# Altium project PGS-System.PrjPcb (part 16 of 16)

## Sheet DEBUG_UART_INTERFACE.SchDoc
size A4; SheetNumber: 26; SheetTotal: 26
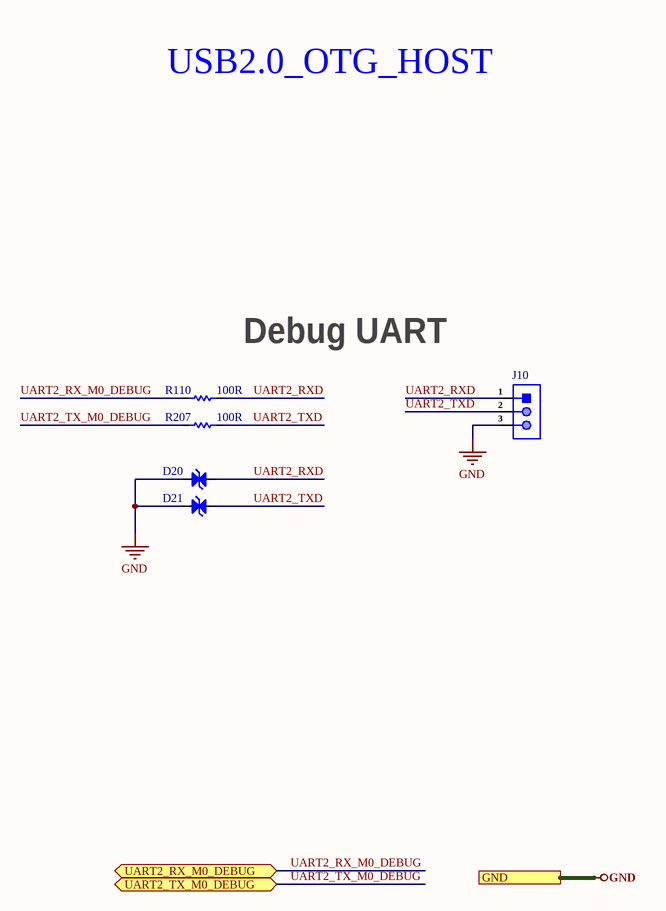
[diagram p27: DEBUG_UART_INTERFACE.SchDoc]

### Parts
D20  ESD5451N  [DFN1006-2L (Bi-Directional)]  (value not drawn)
D21  ESD5451N  [DFN1006-2L (Bi-Directional)]  (value not drawn)
J10  X6511WV-03H-C60D30  [HDR1X3_]  (value not drawn)
R110  100R  [Res-0402]
R207  100R  [Res-0402]

### Ports
GND (see DDR3_SDRAM_INTERFACE[4D], DIGITAL_MEMS_MIC_INTERFACE[3D], eMMC_INTERFACE[3D], ETHERNET_SWITCH_INTERFACE[5C], IR-CUT_LIGHT SENSOR_SHEET[3D], MIPI TO HDMI_MODULE_INTERFACE[3D], MIPI-CSI_RXX_INTERFACE[4C], PoE PD INTERFACE[3D], PoE_PSE_CONTROLLER[5D], POWER_LDO_SHEET[3D], POWER_PMIC_RK809_CODEC[3D], POWER_PMIC_RK809_DC DC[3D], POWER_PMIC_RK809_LDO[4C], POWER_PMIC_RK809_MANAGEMENT[3D], RV1126_AUDIO_SHEET[3D], RV1126_DRAM_SHEET[4C], RV1126_eMMC_SPI-FLASH_SHEET[3D], RV1126_ETHERNET_SHEET[3D], RV1126_OSC-PLL-PMUIO[3C], RV1126_POWER_SHEET[1D], RV1126_SARADC_SHEET[3C], SPI_FLASH_INTERFACE[3D], SYNCHRONOUS _BUCK_CONTROLLER[3D], USB2.0_DEBUG_UART[3D], WIFI_AP6256_SHEET[4D]), UART2_RX_M0_DEBUG (bidir, see RV1126_OSC-PLL-PMUIO[3D], RV1126_SARADC_SHEET[2D], USB2.0_DEBUG_UART[2D]), UART2_TX_M0_DEBUG (bidir, see RV1126_OSC-PLL-PMUIO[3D], RV1126_SARADC_SHEET[2D], USB2.0_DEBUG_UART[2D])

### Nets
GND: D20.2(K) D21.2(K) J10.3 ; port GND  [project net KSENSD]
UART2_RX_M0_DEBUG: R110.2 ; port UART2_RX_M0_DEBUG
UART2_RXD: D20.1(K) J10.1 R110.1
UART2_TX_M0_DEBUG: R207.2 ; port UART2_TX_M0_DEBUG
UART2_TXD: D21.1(K) J10.2 R207.1

### Notes on the sheet
- USB2.0_OTG_HOST
- Debug UART
- File:
- Title:
- Date:
- Page
- Num:
- Total:
- Drawn By: Huzaifa Ali

### Library data of the parts
D20 D21 = ESD5451N: DFN1006-2(0402) ESD Protection Devices ROHS; Manufacturer: TECH PUBLIC; Manufacturer Part Number: ESD5451N; Footprint: DFN1006-2(0402); ComponentLink1Description: LCSC; ComponentLink1URL: https://www.lcsc.com/product-detail/span-style-background-color-ff0-ESD-span-Protection-Devices_TECH-PUBLIC-ESD5451N_C2936977.html; LCSC Part Number: C2936977
J10 = X6511WV-03H-C60D30: Gold 250V 3A Straight Square Pins 2.5mm 3P 260℃ 6mm -40℃~+105℃ 3mm 2.54mm Plugin Black Brass 1x3P Plugin,P=2.54mm Pin Headers ROHS; Manufacturer: XKB; Item Type: Male Header; Manufacturer Part Number: X6511WV-03H-C60D30; Package: Plugin,P=2.54mm; LCSC Part Number: C706875; ComponentLink1Description: LCSC; ComponentLink1URL: https://www.lcsc.com/product-detail/Pin-Headers_XKB-Connectivity-X6511WV-03H-C60D30_C706875.html
R110 R207 = RC0402FR-07100RL: RES 100 OHM 1% 1/16W 0402; Manufacturer: Yageo; Power Rating: 62.5mW; Voltage Rating: 50V; Temperature Coefficient: 100ppm/°C; Max Power Dissipation: 63mW; Item Type: Resistor; Supplier 1: Mouser; Manufacturer Part Number: RC0402FR-07100RL; RoHS: Yes; Category: Chip SMD Resistors; Stock 1: 699545; Pricing 1: 1=0.10000, 10=0.01200, 50=0.01200, 100=0.00500, 1000=0.00300, 2500=0.00200, 10000=0.00100 (USD); Case/Package: 0402; Number of Pins: 2; Case Code (Imperial): 0402; Case Code (Metric): 1005; Size Code: 0402; Min Operating Temperature: -55°C; Max Operating Temperature: 155°C; Tolerance: 1%; Voltage Rating (DC): 50V; Resistance: 100R; Packaging: Tape and Reel; Termination: SMD/SMT; Resistor Type: Thick Film; Features: Moisture Resistant; Series: RC; Number of Terminations: 2; Resistance Tolerance: 1%; Construction: Rectangular; Technology: THICK FILM; Length: 1mm; Width: 0.5mm; Height: 0.32mm; Depth: 0.5mm; RoHS Compliant: Yes; REACH SVHC: No SVHC; Military Standard: Not; Lead Free: Lead Free; ComponentLink1URL: https://datasheet.ciiva.com/11808/0900766b80c66297-11808765.pdf?src-supplier=RSComponents; ComponentLink1Description: https://datasheet.ciiva.com/11808/0900766b80c66297-11808765.pdf?src-supplier=RSComponents; ComponentLink2URL: https://datasheet.ciiva.com/7849/1784430-7849810.pdf?src-supplier=Element14; ComponentLink2Description: https://datasheet.ciiva.com/7849/1784430-7849810.pdf?src-supplier=Element14; ComponentLink3URL: https://datasheet.ciiva.com/28367/1018594-28367226.pdf?src-supplier=Element14; ComponentLink3Description: https://datasheet.ciiva.com/28367/1018594-28367226.pdf?src-supplier=Element14; ComponentLink4URL: https://datasheet.ciiva.com/22747/1018594-22747511.pdf?src-supplier=Element14; ComponentLink4Description: https://datasheet.ciiva.com/22747/1018594-22747511.pdf?src-supplier=Element14; ComponentLink5URL: https://datasheet.ciiva.com/12667/pyu-rc0402-51-rohs-l-6-r-12667957.pdf?src-supplier=Mouser; ComponentLink5Description: https://datasheet.ciiva.com/12667/pyu-rc0402-51-rohs-l-6-r-12667957.pdf?src-supplier=Mouser; ComponentLink6URL: https://datasheet.ciiva.com/15189/getdatasheetpartid-329466-15189335.pdf?src-supplier=Verical; ComponentLink6Description: https://datasheet.ciiva.com/15189/getdatasheetpartid-329466-15189335.pdf?src-supplier=Verical; ComponentLink7URL: https://datasheet.ciiva.com/16740/pyu-rc0402-51-rohs-l-6-r-16740566.pdf?src-supplier=Future+Electronics; ComponentLink7Description: https://datasheet.ciiva.com/16740/pyu-rc0402-51-rohs-l-6-r-16740566.pdf?src-supplier=Future+Electronics; Supplier Part Number 1: 603-RC0402FR-07100RL; LCSC Part Number: C106232

## Nets that join several sheets
DVDDIO_3V3: ETH_PoE-PD_INTERFACE (R57.2), PoE_PSE_CONTROLLER (R60.2), ETH_SWITCH_INTERFACE (9 pins)
KSENSD: ETH_PoE-PD_INTERFACE (22 pins), PoE_PSE_CONTROLLER (38 pins), BUCK_CONVERTER_SHEET1 (20 pins), BUCK_CONTROLLER_SHEET2 (12 pins), POWER_LDO_SHEET (23 pins), POWER_PMIC_RK809_DC DC (14 pins), POWER_PMIC_RK809_LDO (18 pins), POWER_PMIC_RK809_MGM (17 pins), POWER_PMIC_RK809_CODEC (7 pins), RV1126_POWER_SHEET (127 pins), RV1126_DRAM_SHEET (10 pins), RV1126_SARADC_SHEET (10 pins), RV1126_AUDIO_SHEET (C162.1), RV1126_ETHERNET_SHEET (8 pins), RV1126_eMMC_SPI-FLASH (5 pins), RV1126_OSC-PLL-PMUIO (12 pins), RV1126_SDMMC_SHEET (C133.1), DDR3_SDRAM_SHEET (77 pins), eMMC_INTERFACE (22 pins), SPI_FLASH_INTERFACE (C173.1 C174.2 SW4.2 U10.4), ETH_SWITCH_INTERFACE (40 pins), MIPI-CSI_RXX_INTERFACE (28 pins), MIPI TO HDMI_MODULE (19 pins), DIGITAL_MEMS_INTERFACE (7 pins), SPEARKER_INTERFACE_SHEET (9 pins), IR-CUT_LIGHT SENSOR_SHEET (14 pins), USB2.0_DEBUG_UART (24 pins), DEBUG_UART_INTERFACE (D20.2 D21.2 J10.3)
VCC0V8_PMU: POWER_PMIC_RK809_LDO (C16.2 U1.20), RV1126_OSC-PLL-PMUIO (C169.2 C170.2 U5.P10 U5.P11)
VCC1V1_POE: POWER_LDO_SHEET (6 pins), ETH_SWITCH_INTERFACE (FB5.1 FB6.1)
VCC1V2_DVDD: POWER_PMIC_RK809_LDO (C20.2 U1.31), MIPI-CSI_RXX_INTERFACE (6 pins)
VCC1V8: POWER_PMIC_RK809_LDO (C17.2 U1.28), RV1126_ETHERNET_SHEET (R69.2)
VCC1V8_DOVDD: POWER_PMIC_RK809_LDO (C19.2 U1.29), MIPI-CSI_RXX_INTERFACE (C149.2 C154.2 J4.22 J5.22)
VCC1V8_PMU: POWER_PMIC_RK809_LDO (C15.2 U1.21), POWER_PMIC_RK809_MGM (R11.1), RV1126_OSC-PLL-PMUIO (6 pins)
VCC2V8_AVDD: POWER_PMIC_RK809_LDO (C21.2 U1.3), MIPI-CSI_RXX_INTERFACE (6 pins)
VCC3V3: POWER_PMIC_RK809_LDO (C25.2 U1.58), RV1126_ETHERNET_SHEET (C127.2 FB11.2 R68.2)
VCC3V3_POE: PoE_PSE_CONTROLLER (FB8.1), POWER_LDO_SHEET (6 pins), ETH_SWITCH_INTERFACE (D5.2 FB2.1 FB4.1 R43.1)
VCC3V3_SYS: POWER_PMIC_RK809_DC DC (C5.2 L2.1 U1.64), POWER_PMIC_RK809_LDO (C26.2 U1.57), POWER_PMIC_RK809_MGM (R6.1 R7.1), MIPI TO HDMI_MODULE (C175.2 C176.2 J6.6 J6.7)
VCC5V0_SYS: BUCK_CONVERTER_SHEET1 (R182.2 SB9.2 TP6.1), POWER_LDO_SHEET (11 pins), POWER_PMIC_RK809_DC DC (8 pins), POWER_PMIC_RK809_LDO (C22.2 C30.2 U1.4 U1.54), POWER_PMIC_RK809_MGM (C32.2 R5.2 U1.45), POWER_PMIC_RK809_CODEC (C38.1 U1.33), MIPI TO HDMI_MODULE (C179.2 U11.5), IR-CUT_LIGHT SENSOR_SHEET (C185.2 C188.2 U12.1 U13.1), USB2.0_DEBUG_UART (C194.2 U14.5)
VCC12V0: BUCK_CONTROLLER_SHEET2 (R77.2 R78.1 SB2.2 TP14.1), SPEARKER_INTERFACE_SHEET (R12.2 U6.6)
VCC_0V8: MIPI-CSI_RXX_INTERFACE (R87.2), MIPI TO HDMI_MODULE (R96.2), USB2.0_DEBUG_UART (C191.2 U5.R6)
VCC_1V8: POWER_PMIC_RK809_MGM (R9.1), RV1126_POWER_SHEET (C108.2 U5.H14), RV1126_SARADC_SHEET (C117.2 R36.2 R38.2 U5.E16), RV1126_AUDIO_SHEET (C162.2 U5.T12), RV1126_eMMC_SPI-FLASH (R82.1), RV1126_SDMMC_SHEET (C133.2 U5.E14), MIPI-CSI_RXX_INTERFACE (R88.2 R109.2), MIPI TO HDMI_MODULE (R97.2), DIGITAL_MEMS_INTERFACE (C182.2 FB1.1), IR-CUT_LIGHT SENSOR_SHEET (R104.2 R105.2), USB2.0_DEBUG_UART (C192.2 U5.R7)
VCC_3V3: RV1126_SARADC_SHEET (C205.2 C206.2 U5.J15 U5.K15), RV1126_eMMC_SPI-FLASH (R89.1 R91.1), RV1126_OSC-PLL-PMUIO (C172.2 U5.R8), eMMC_INTERFACE (8 pins), USB2.0_DEBUG_UART (C193.2 Q4.2 R111.2 U5.T7)
VCC_BUCK5: POWER_LDO_SHEET (R118.1), POWER_PMIC_RK809_LDO (8 pins)
VCC_DDR: POWER_PMIC_RK809_DC DC (5 pins), RV1126_DRAM_SHEET (15 pins), DDR3_SDRAM_SHEET (59 pins)
VCCIO_FLASH: RV1126_eMMC_SPI-FLASH (5 pins), eMMC_INTERFACE (12 pins), SPI_FLASH_INTERFACE (5 pins)
VCCIO_SD: POWER_PMIC_RK809_LDO (C23.2 U1.5), RV1126_eMMC_SPI-FLASH (C54.2 U5.T13)
VDD_ARM: POWER_PMIC_RK809_DC DC (7 pins), RV1126_POWER_SHEET (7 pins)
VDD_LOGIC: POWER_LDO_SHEET (9 pins), RV1126_POWER_SHEET (13 pins)
VDD_NPU_VEPU: POWER_PMIC_RK809_DC DC (7 pins), RV1126_POWER_SHEET (22 pins)
VDD_POE: ETH_PoE-PD_INTERFACE (11 pins), PoE_PSE_CONTROLLER (8 pins), BUCK_CONVERTER_SHEET1 (10 pins), BUCK_CONTROLLER_SHEET2 (5 pins)
VREF_DDR: RV1126_DRAM_SHEET (U5.M6), DDR3_SDRAM_SHEET (R28.2)
AMP_IN_N: POWER_PMIC_RK809_CODEC (P1.1 U1.34), SPEARKER_INTERFACE_SHEET (U6.4)
AMP_IN_P: POWER_PMIC_RK809_CODEC (P2.1 U1.32), SPEARKER_INTERFACE_SHEET (U6.3)
AUDIO_CTRL: RV1126_AUDIO_SHEET (U5.U11), SPEARKER_INTERFACE_SHEET (R13.1)
DDR3_A0: RV1126_DRAM_SHEET (U5.D10), DDR3_SDRAM_SHEET (U3.N3 U4.N3)
DDR3_A1: RV1126_DRAM_SHEET (U5.A8), DDR3_SDRAM_SHEET (U3.P7 U4.P7)
DDR3_A2: RV1126_DRAM_SHEET (U5.D11), DDR3_SDRAM_SHEET (U3.P3 U4.P3)
DDR3_A3: RV1126_DRAM_SHEET (U5.C9), DDR3_SDRAM_SHEET (U3.N2 U4.N2)
DDR3_A4: RV1126_DRAM_SHEET (U5.B8), DDR3_SDRAM_SHEET (U3.P8 U4.P8)
DDR3_A5: RV1126_DRAM_SHEET (U5.B9), DDR3_SDRAM_SHEET (U3.P2 U4.P2)
DDR3_A6: RV1126_DRAM_SHEET (U5.A9), DDR3_SDRAM_SHEET (U3.R8 U4.R8)
DDR3_A7: RV1126_DRAM_SHEET (U5.C11), DDR3_SDRAM_SHEET (U3.R2 U4.R2)
DDR3_A8: RV1126_DRAM_SHEET (U5.A10), DDR3_SDRAM_SHEET (U3.T8 U4.T8)
DDR3_A9: RV1126_DRAM_SHEET (U5.B11), DDR3_SDRAM_SHEET (U3.R3 U4.R3)
DDR3_A10: RV1126_DRAM_SHEET (U5.B5), DDR3_SDRAM_SHEET (U3.L7 U4.L7)
DDR3_A11: RV1126_DRAM_SHEET (U5.B10), DDR3_SDRAM_SHEET (U3.R7 U4.R7)
DDR3_A12: RV1126_DRAM_SHEET (U5.A7), DDR3_SDRAM_SHEET (U3.N7 U4.N7)
DDR3_A13: RV1126_DRAM_SHEET (U5.A12), DDR3_SDRAM_SHEET (U3.T3 U4.T3)
DDR3_A14: RV1126_DRAM_SHEET (U5.A11), DDR3_SDRAM_SHEET (U3.T7 U4.T7)
DDR3_A15: RV1126_DRAM_SHEET (U5.B6), DDR3_SDRAM_SHEET (U3.M7 U4.M7)
DDR3_BA0: RV1126_DRAM_SHEET (U5.D8), DDR3_SDRAM_SHEET (U3.M2 U4.M2)
DDR3_BA1: RV1126_DRAM_SHEET (U5.B7), DDR3_SDRAM_SHEET (U3.N8 U4.N8)
DDR3_BA2: RV1126_DRAM_SHEET (U5.C8), DDR3_SDRAM_SHEET (U3.M3 U4.M3)
DDR3_CASN: RV1126_DRAM_SHEET (U5.C6), DDR3_SDRAM_SHEET (U3.K3 U4.K3)
DDR3_CKE: RV1126_DRAM_SHEET (U5.A4), DDR3_SDRAM_SHEET (U3.J9 U3.K9 U4.J9 U4.K9)
DDR3_CLK_N: RV1126_DRAM_SHEET (U5.D5), DDR3_SDRAM_SHEET (R26.1 U3.K7 U4.K7)
DDR3_CLK_P: RV1126_DRAM_SHEET (U5.D4), DDR3_SDRAM_SHEET (R25.1 U3.J7 U4.J7)
DDR3_CS0N: RV1126_DRAM_SHEET (U5.A5), DDR3_SDRAM_SHEET (U3.L2 U4.L2)
DDR3_CS1N: RV1126_DRAM_SHEET (U5.E7), DDR3_SDRAM_SHEET (U3.L1 U4.L1)
DDR3_ODT0: RV1126_DRAM_SHEET (U5.B4), DDR3_SDRAM_SHEET (U3.K1 U4.K1)
DDR3_ODT1: RV1126_DRAM_SHEET (U5.D6), DDR3_SDRAM_SHEET (U3.J1 U4.J1)
DDR3_RASN: RV1126_DRAM_SHEET (U5.D7), DDR3_SDRAM_SHEET (U3.J3 U4.J3)
DDR3_RST: RV1126_DRAM_SHEET (U5.C4), DDR3_SDRAM_SHEET (U3.T2 U4.T2)
DDR3_WEN: RV1126_DRAM_SHEET (U5.A6), DDR3_SDRAM_SHEET (U3.L3 U4.L3)
DDR_D0: RV1126_DRAM_SHEET (U5.K4), DDR3_SDRAM_SHEET (U4.B8)
DDR_D1: RV1126_DRAM_SHEET (U5.J4), DDR3_SDRAM_SHEET (U4.A2)
DDR_D2: RV1126_DRAM_SHEET (U5.P4), DDR3_SDRAM_SHEET (U4.A3)
DDR_D3: RV1126_DRAM_SHEET (U5.N4), DDR3_SDRAM_SHEET (U4.C2)
DDR_D4: RV1126_DRAM_SHEET (U5.J3), DDR3_SDRAM_SHEET (U4.C8)
DDR_D5: RV1126_DRAM_SHEET (U5.K3), DDR3_SDRAM_SHEET (U4.A7)
DDR_D6: RV1126_DRAM_SHEET (U5.M4), DDR3_SDRAM_SHEET (U4.C3)
DDR_D7: RV1126_DRAM_SHEET (U5.P3), DDR3_SDRAM_SHEET (U4.D7)
DDR_D8: RV1126_DRAM_SHEET (U5.D2), DDR3_SDRAM_SHEET (U3.H8)
DDR_D9: RV1126_DRAM_SHEET (U5.D1), DDR3_SDRAM_SHEET (U3.F7)
DDR_D10: RV1126_DRAM_SHEET (U5.H2), DDR3_SDRAM_SHEET (U3.F8)
DDR_D11: RV1126_DRAM_SHEET (U5.H1), DDR3_SDRAM_SHEET (U3.F2)
DDR_D12: RV1126_DRAM_SHEET (U5.G1), DDR3_SDRAM_SHEET (U3.E3)
DDR_D13: RV1126_DRAM_SHEET (U5.E1), DDR3_SDRAM_SHEET (U3.H7)
DDR_D14: RV1126_DRAM_SHEET (U5.C1), DDR3_SDRAM_SHEET (U3.H3)
DDR_D15: RV1126_DRAM_SHEET (U5.C2), DDR3_SDRAM_SHEET (U3.G2)
DDR_D16: RV1126_DRAM_SHEET (U5.K1), DDR3_SDRAM_SHEET (U3.A2)
DDR_D17: RV1126_DRAM_SHEET (U5.K2), DDR3_SDRAM_SHEET (U3.C3)
DDR_D18: RV1126_DRAM_SHEET (U5.J1), DDR3_SDRAM_SHEET (U3.D7)
DDR_D19: RV1126_DRAM_SHEET (U5.J2), DDR3_SDRAM_SHEET (U3.A7)
DDR_D20: RV1126_DRAM_SHEET (U5.P2), DDR3_SDRAM_SHEET (U3.B8)
DDR_D21: RV1126_DRAM_SHEET (U5.L1), DDR3_SDRAM_SHEET (U3.C2)
DDR_D22: RV1126_DRAM_SHEET (U5.M1), DDR3_SDRAM_SHEET (U3.A3)
DDR_D23: RV1126_DRAM_SHEET (U5.P1), DDR3_SDRAM_SHEET (U3.C8)
DDR_D24: RV1126_DRAM_SHEET (U5.A2), DDR3_SDRAM_SHEET (U4.H3)
DDR_D25: RV1126_DRAM_SHEET (U5.A3), DDR3_SDRAM_SHEET (U4.H7)
DDR_D26: RV1126_DRAM_SHEET (U5.G4), DDR3_SDRAM_SHEET (U4.G2)
DDR_D27: RV1126_DRAM_SHEET (U5.F4), DDR3_SDRAM_SHEET (U4.F8)
DDR_D28: RV1126_DRAM_SHEET (U5.H3), DDR3_SDRAM_SHEET (U4.E3)
DDR_D29: RV1126_DRAM_SHEET (U5.G3), DDR3_SDRAM_SHEET (U4.F2)
DDR_D30: RV1126_DRAM_SHEET (U5.B1), DDR3_SDRAM_SHEET (U4.F7)
DDR_D31: RV1126_DRAM_SHEET (U5.B2), DDR3_SDRAM_SHEET (U4.H8)
DDR_DM0: RV1126_DRAM_SHEET (U5.N3), DDR3_SDRAM_SHEET (U4.D3)
DDR_DM1: RV1126_DRAM_SHEET (U5.E2), DDR3_SDRAM_SHEET (U3.E7)
DDR_DM2: RV1126_DRAM_SHEET (U5.M2), DDR3_SDRAM_SHEET (U3.D3)
DDR_DM3: RV1126_DRAM_SHEET (U5.B3), DDR3_SDRAM_SHEET (U4.E7)
DDR_DQS0_N: RV1126_DRAM_SHEET (U5.L3), DDR3_SDRAM_SHEET (U4.B7)
DDR_DQS0_P: RV1126_DRAM_SHEET (U5.L4), DDR3_SDRAM_SHEET (U4.C7)
DDR_DQS1_N: RV1126_DRAM_SHEET (U5.F1), DDR3_SDRAM_SHEET (U3.G3)
DDR_DQS1_P: RV1126_DRAM_SHEET (U5.F2), DDR3_SDRAM_SHEET (U3.F3)
DDR_DQS2_N: RV1126_DRAM_SHEET (U5.N1), DDR3_SDRAM_SHEET (U3.B7)
DDR_DQS2_P: RV1126_DRAM_SHEET (U5.N2), DDR3_SDRAM_SHEET (U3.C7)
DDR_DQS3_N: RV1126_DRAM_SHEET (U5.E3), DDR3_SDRAM_SHEET (U4.G3)
DDR_DQS3_P: RV1126_DRAM_SHEET (U5.D3), DDR3_SDRAM_SHEET (U4.F3)
eMMC_CLK: RV1126_eMMC_SPI-FLASH (U5.T1), eMMC_INTERFACE (U2.M6)
eMMC_CMD: RV1126_eMMC_SPI-FLASH (U5.T4), eMMC_INTERFACE (R23.2 U2.M5)
eMMC_DATA0: RV1126_eMMC_SPI-FLASH (U5.W2), eMMC_INTERFACE (R22.2 SW5.1 U2.A3)
eMMC_DATA1: RV1126_eMMC_SPI-FLASH (U5.W1), eMMC_INTERFACE (U2.A4)
eMMC_DATA2: RV1126_eMMC_SPI-FLASH (U5.V4), eMMC_INTERFACE (U2.A5)
eMMC_DATA3: RV1126_eMMC_SPI-FLASH (U5.V3), eMMC_INTERFACE (U2.B2)
eMMC_DATA4: RV1126_eMMC_SPI-FLASH (U5.V2), eMMC_INTERFACE (U2.B3)
eMMC_DATA5: RV1126_eMMC_SPI-FLASH (U5.V1), eMMC_INTERFACE (U2.B4)
eMMC_DATA6: RV1126_eMMC_SPI-FLASH (U5.U4), eMMC_INTERFACE (U2.B5)
eMMC_DATA7: RV1126_eMMC_SPI-FLASH (U5.U3), eMMC_INTERFACE (U2.B6)
eMMC_RSTN: RV1126_eMMC_SPI-FLASH (R24.1 U5.R3), eMMC_INTERFACE (U2.K5)
FLASH_VOL_SEL: RV1126_eMMC_SPI-FLASH (R91.2 R92.1), RV1126_OSC-PLL-PMUIO (U5.Y8)
FSPI_CLK: RV1126_eMMC_SPI-FLASH (R24.2), SPI_FLASH_INTERFACE (U10.6)
FSPI_CS0n: RV1126_eMMC_SPI-FLASH (U5.U2), SPI_FLASH_INTERFACE (U10.1)
FSPI_D0: RV1126_eMMC_SPI-FLASH (U5.T2), SPI_FLASH_INTERFACE (SW4.1 U10.5)
FSPI_D1: RV1126_eMMC_SPI-FLASH (U5.R2), SPI_FLASH_INTERFACE (U10.2)
FSPI_D2: RV1126_eMMC_SPI-FLASH (U5.T3), SPI_FLASH_INTERFACE (R94.1 U10.3)
FSPI_D3: RV1126_eMMC_SPI-FLASH (U5.R4), SPI_FLASH_INTERFACE (R95.1 U10.7)
I2C0_SCL_PMIC: POWER_PMIC_RK809_MGM (R7.2 U1.1), RV1126_OSC-PLL-PMUIO (U5.AA7)
I2C0_SDA_PMIC: POWER_PMIC_RK809_MGM (R6.2 U1.2), RV1126_OSC-PLL-PMUIO (U5.Y7)
I2S0_LRCK_TX_M0: POWER_PMIC_RK809_CODEC (R16.1), RV1126_AUDIO_SHEET (U5.W11)
I2S0_MCLK_M0: POWER_PMIC_RK809_CODEC (R14.1), RV1126_AUDIO_SHEET (U5.U12)
I2S0_SCLK_TX_M0: POWER_PMIC_RK809_CODEC (R15.1), RV1126_AUDIO_SHEET (U5.W12)
I2S0_SDI3_M0: POWER_PMIC_RK809_CODEC (R18.1), RV1126_AUDIO_SHEET (U5.T11)
I2S0_SDO0_M0: POWER_PMIC_RK809_CODEC (R17.1), RV1126_AUDIO_SHEET (U5.Y11)
ICR_AIN1: RV1126_SARADC_SHEET (U5.J18), IR-CUT_LIGHT SENSOR_SHEET (U12.8)
ICR_AIN2: RV1126_SARADC_SHEET (U5.L17), IR-CUT_LIGHT SENSOR_SHEET (U13.8)
ICR_BIN1: RV1126_SARADC_SHEET (U5.H18), IR-CUT_LIGHT SENSOR_SHEET (U12.5)
ICR_BIN2: RV1126_SARADC_SHEET (U5.G19), IR-CUT_LIGHT SENSOR_SHEET (U13.5)
LIGHT_SENSOR1: RV1126_SARADC_SHEET (U5.B18), IR-CUT_LIGHT SENSOR_SHEET (C186.2 D15.2 J8.1 R104.1)
LIGHT_SENSOR2: RV1126_SARADC_SHEET (U5.A18), IR-CUT_LIGHT SENSOR_SHEET (C187.2 D16.2 J8.2 R105.1)
MIPI_PWREN: RV1126_OSC-PLL-PMUIO (U5.V9), MIPI TO HDMI_MODULE (R99.2)
MIPI_RESET: RV1126_OSC-PLL-PMUIO (U5.W8), MIPI TO HDMI_MODULE (J6.10)
P1_LED1: ETH_PoE-PD_INTERFACE (D30.2 R56.2), ETH_SWITCH_INTERFACE (U16.70)
P1_LED2: ETH_PoE-PD_INTERFACE (D31.2 R58.2), ETH_SWITCH_INTERFACE (R64.1 U16.68)
P1_MDIA_N: ETH_PoE-PD_INTERFACE (T1.3), ETH_SWITCH_INTERFACE (U16.5)
P1_MDIA_P: ETH_PoE-PD_INTERFACE (T1.2), ETH_SWITCH_INTERFACE (U16.4)
P1_MDIB_N: ETH_PoE-PD_INTERFACE (T1.6), ETH_SWITCH_INTERFACE (U16.7)
P1_MDIB_P: ETH_PoE-PD_INTERFACE (T1.5), ETH_SWITCH_INTERFACE (U16.6)
P1_MDIC_N: ETH_PoE-PD_INTERFACE (T1.9), ETH_SWITCH_INTERFACE (U16.10)
P1_MDIC_P: ETH_PoE-PD_INTERFACE (T1.8), ETH_SWITCH_INTERFACE (U16.9)
P1_MDID_N: ETH_PoE-PD_INTERFACE (T1.12), ETH_SWITCH_INTERFACE (U16.12)
P1_MDID_P: ETH_PoE-PD_INTERFACE (T1.11), ETH_SWITCH_INTERFACE (U16.11)
P3_LED1: PoE_PSE_CONTROLLER (D25.2 R59.2), ETH_SWITCH_INTERFACE (U16.67)
P3_LED2: PoE_PSE_CONTROLLER (D26.2 R61.2), ETH_SWITCH_INTERFACE (U16.65)
P3_MDIA_N: PoE_PSE_CONTROLLER (J1.10), ETH_SWITCH_INTERFACE (U16.16)
P3_MDIA_P: PoE_PSE_CONTROLLER (J1.11), ETH_SWITCH_INTERFACE (U16.15)
P3_MDIB_N: PoE_PSE_CONTROLLER (J1.5), ETH_SWITCH_INTERFACE (U16.18)
P3_MDIB_P: PoE_PSE_CONTROLLER (J1.4), ETH_SWITCH_INTERFACE (U16.17)
P3_MDIC_N: PoE_PSE_CONTROLLER (J1.2), ETH_SWITCH_INTERFACE (U16.21)
P3_MDIC_P: PoE_PSE_CONTROLLER (J1.3), ETH_SWITCH_INTERFACE (U16.20)
P3_MDID_N: PoE_PSE_CONTROLLER (J1.9), ETH_SWITCH_INTERFACE (U16.23)
P3_MDID_P: PoE_PSE_CONTROLLER (J1.8), ETH_SWITCH_INTERFACE (U16.22)
PDM_CLK: RV1126_AUDIO_SHEET (U5.Y12), DIGITAL_MEMS_INTERFACE (R102.2)
PDM_CLK1: POWER_PMIC_RK809_CODEC (R19.1), RV1126_AUDIO_SHEET (U5.V12)
PDM_SDI0: RV1126_AUDIO_SHEET (U5.AA12), DIGITAL_MEMS_INTERFACE (R103.2)
PMIC_INT: POWER_PMIC_RK809_MGM (U1.7), RV1126_OSC-PLL-PMUIO (U5.W10)
PMIC_SLEEP: POWER_PMIC_RK809_MGM (U1.49), RV1126_OSC-PLL-PMUIO (U5.Y10)
RESET: POWER_PMIC_RK809_MGM (5 pins), RV1126_OSC-PLL-PMUIO (C207.2 R200.2 U5.W7)
RGMII_MDC: RV1126_ETHERNET_SHEET (U5.N21), ETH_SWITCH_INTERFACE (U16.1)
RGMII_MDIO: RV1126_ETHERNET_SHEET (U5.N20), ETH_SWITCH_INTERFACE (R194.2 U16.2)
RGMII_RST: RV1126_ETHERNET_SHEET (U5.P17), ETH_SWITCH_INTERFACE (C238.2 D5.1 R43.2 U16.76)
RGMII_RXC: RV1126_ETHERNET_SHEET (U5.P20), ETH_SWITCH_INTERFACE (U16.47)
RGMII_RXD0: RV1126_ETHERNET_SHEET (U5.R20), ETH_SWITCH_INTERFACE (R48.2)
RGMII_RXD1: RV1126_ETHERNET_SHEET (U5.R21), ETH_SWITCH_INTERFACE (R49.2)
RGMII_RXD2: RV1126_ETHERNET_SHEET (U5.R18), ETH_SWITCH_INTERFACE (R50.2)
RGMII_RXD3: RV1126_ETHERNET_SHEET (U5.T19), ETH_SWITCH_INTERFACE (R51.2)
RGMII_RXDV: RV1126_ETHERNET_SHEET (U5.M17), ETH_SWITCH_INTERFACE (U16.46)
RGMII_TXC: RV1126_ETHERNET_SHEET (U5.P19), ETH_SWITCH_INTERFACE (U16.48)
RGMII_TXD0: RV1126_ETHERNET_SHEET (U5.R19), ETH_SWITCH_INTERFACE (R47.2)
RGMII_TXD1: RV1126_ETHERNET_SHEET (U5.T21), ETH_SWITCH_INTERFACE (R46.2)
RGMII_TXD2: RV1126_ETHERNET_SHEET (U5.T20), ETH_SWITCH_INTERFACE (R45.2)
RGMII_TXD3: RV1126_ETHERNET_SHEET (U5.N17), ETH_SWITCH_INTERFACE (R44.2)
RGMII_TXEN: RV1126_ETHERNET_SHEET (U5.N18), ETH_SWITCH_INTERFACE (U16.49)
UART2_RX_M0_DEBUG: RV1126_SARADC_SHEET (U5.G18), DEBUG_UART_INTERFACE (R110.2)
UART2_TX_M0_DEBUG: RV1126_SARADC_SHEET (U5.H16), DEBUG_UART_INTERFACE (R207.2)
USB_CTRL: RV1126_OSC-PLL-PMUIO (U5.AA4), USB2.0_DEBUG_UART (R113.1)
USB_PWREN: RV1126_OSC-PLL-PMUIO (U5.U9), USB2.0_DEBUG_UART (R116.2)